# Altium schematic sheet fabscope_schematic.schdoc
size 594 x 419 mm; Symbol: Drawing-Symbol_A4; @Project Name: fab_scope_esp; @Page Count: 1; @Update Date: 2026-10-18; @Create Date: 2026-10-18; @Schematic Name: Schematic1; @Page No: 1; @Page Name: P1; Company: EasyEDA.com; Version: V1.0; Page Size: A4; Device: Drawing-Symbol_A4; @Create Time: 13:39:33; @Update Time: 13:39:33; Border: 1; Width: 2338; Height: 1652; Region Start: 1; X Region Count: 6; Y Region Count: 4; Blade Width: 10; Title Block Position: 3; @Board Name: Board1
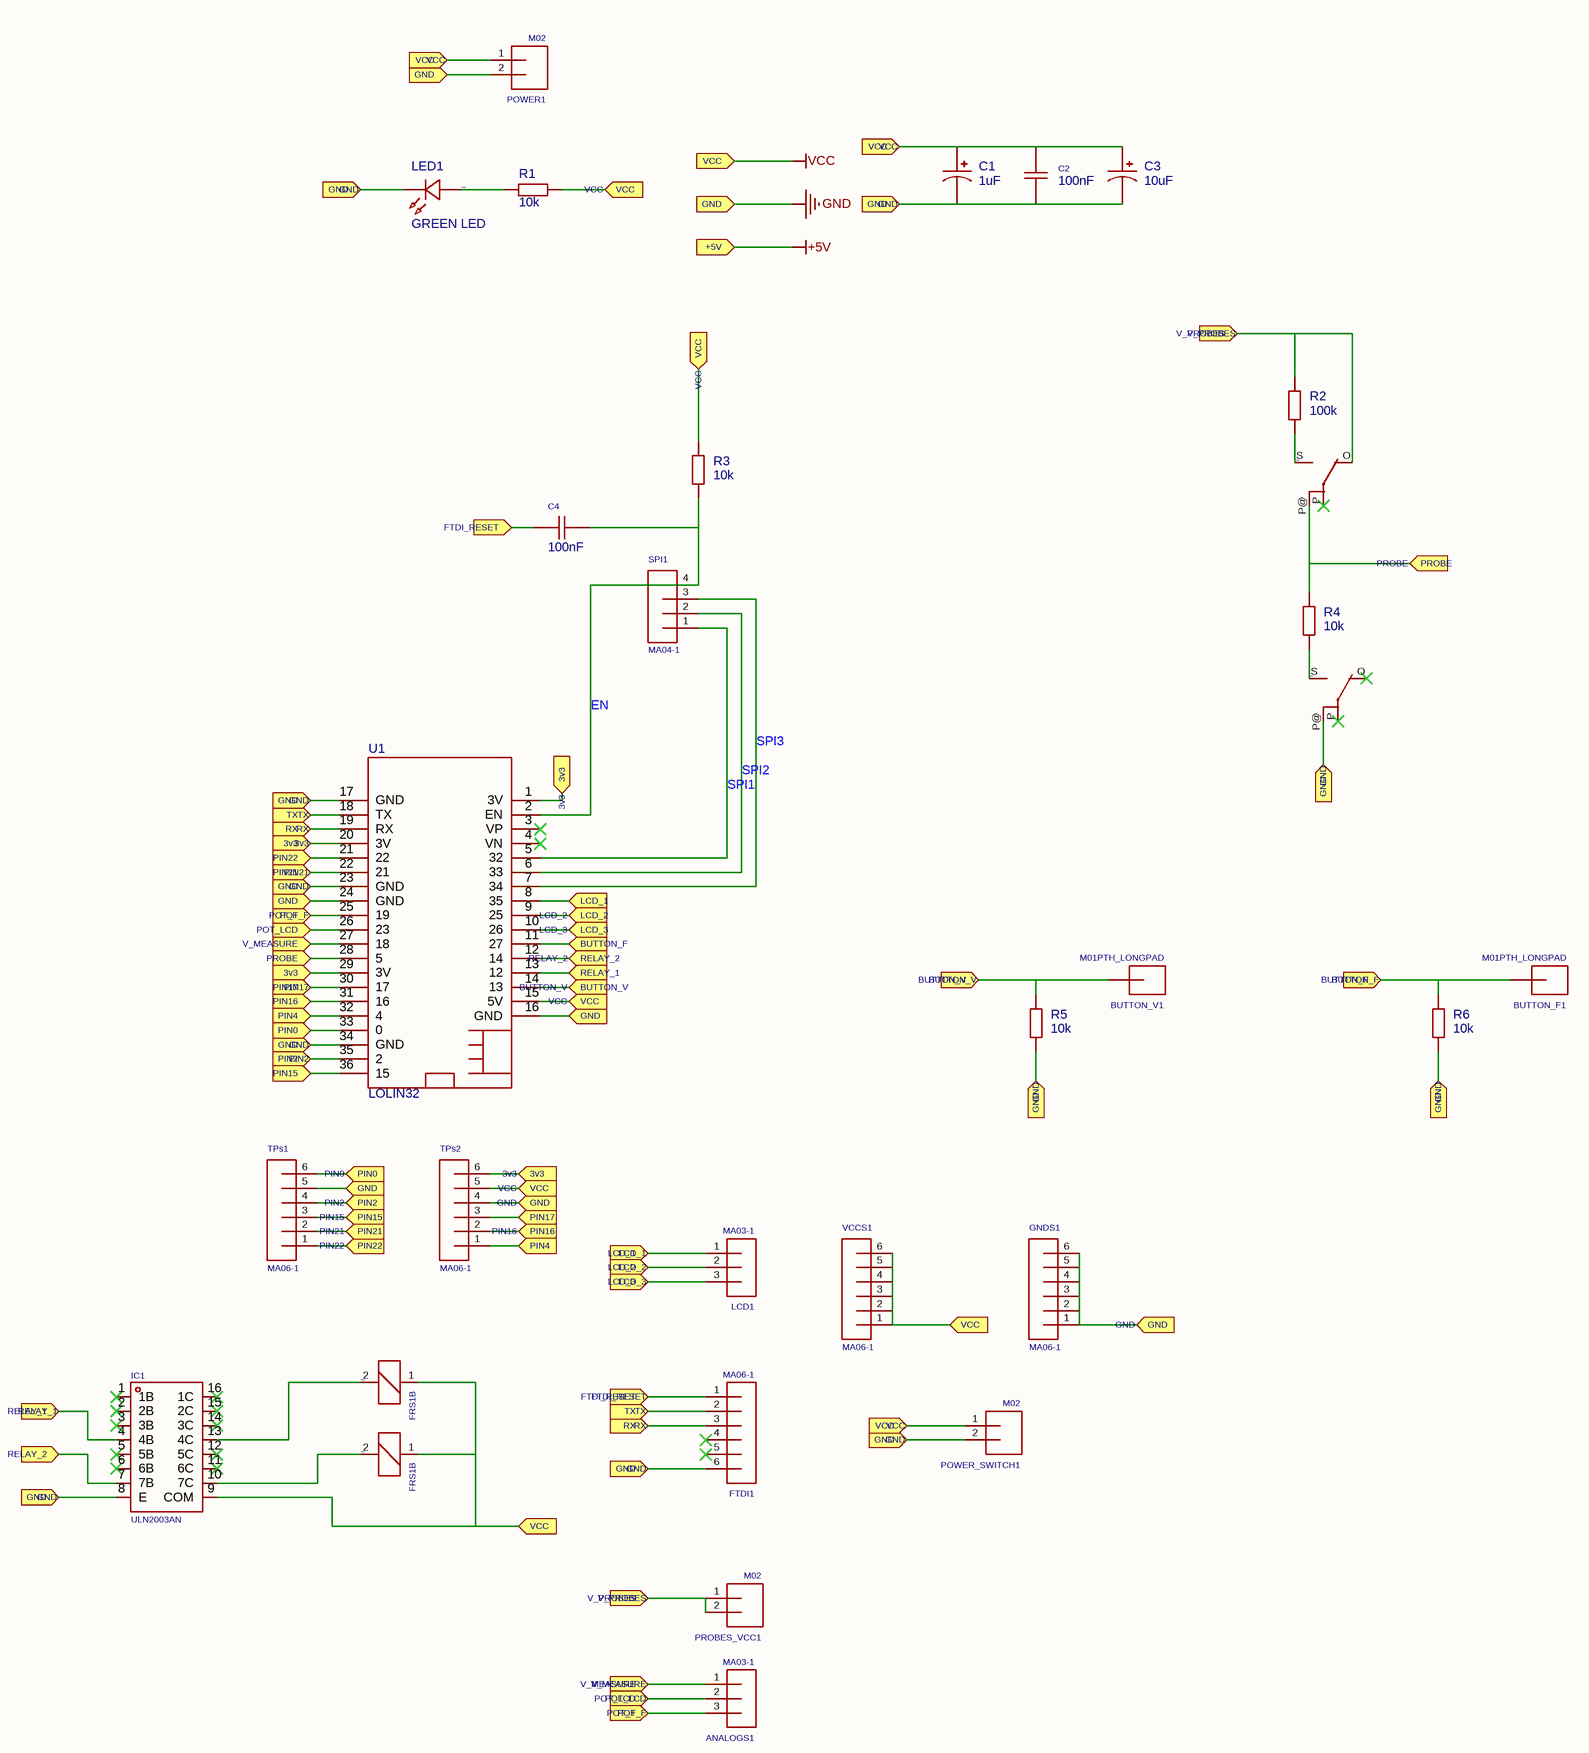
[diagram p0: fabscope_schematic.schdoc]

## Parts
ANALOGS1  MA03-1  [MA03-1]
BUTTON_F1  M01PTH_LONGPAD  [1X01_LONGPAD]
BUTTON_V1  M01PTH_LONGPAD  [1X01_LONGPAD]
C1  1uF  [CAP-TH_BD6.3-P5.00-D0.5-FD]
C2  100nF  [CAP-TH_L3.0-W2.0-P5.08-D0.7]
C3  10uF  [CAP-TH_BD5.0-P2.00-D0.8-FD]
C4  100nF  [CAP-TH_L3.0-W2.0-P5.08-D0.7]
FTDI1  MA06-1  [MA06-1]
GNDS1  MA06-1  [MA06-1]
IC1  ULN2003AN  [DIP-16_L19.7-W6.6-P2.54-LS7.6-BL]
K1  FRS1B  [FRS1B]  (parts A,B of 2)
K2  FRS1B  [FRS1B]  (parts A,B of 2)
LCD1  MA03-1  [MA03-1]
LED1  GREEN LED  [LED-TH_BD5.9-P2.54-FD-1]
POWER1  M02  [02P]
POWER_SWITCH1  M02  [02P]
PROBES_VCC1  M02  [02P]
R1  10k  [RES-TH_BD2.4-L6.3-P10.30-D0.6]
R2  100k  [RES-TH_BD2.4-L6.3-P10.30-D0.6]
R3  10k  [RES-TH_BD2.4-L6.3-P10.30-D0.6]
R4  10k  [RES-TH_BD2.4-L6.3-P10.30-D0.6]
R5  10k  [RES-TH_BD2.4-L6.3-P10.30-D0.6]
R6  10k  [RES-TH_BD2.4-L6.3-P10.30-D0.6]
SPI1  MA04-1  [MA04-1]
TPs1  MA06-1  [MA06-1]
TPs2  MA06-1  [MA06-1]
U1  LOLIN32  [LOLIN32]
VCCS1  MA06-1  [MA06-1]

## Ports
3v3 (in), +5V (in), BUTTON_F (in), BUTTON_V (in), FTDI_RESET (in), GND (in), LCD_1 (in), LCD_2 (in), LCD_3 (in), PIN0 (in), PIN2 (in), PIN4 (in), PIN15 (in), PIN16 (in), PIN17 (in), PIN21 (in), PIN22 (in), POT_F (in), POT_LCD (in), PROBE (in), RELAY_1 (in), RELAY_2 (in), RX (in), TX (in), V_MEASURE (in), V_PROBES (in), VCC (in)

## Nets
+5V: port +5V
GND: C1.2 C2.1 C3.2 FTDI1.6 GNDS1.1 GNDS1.2 GNDS1.3 GNDS1.4 GNDS1.5 GNDS1.6 IC1.8(E) K2.P@(P@1) LED1.2(K) POWER1.2 POWER_SWITCH1.2 R5.1 R6.1 TPs1.5 TPs2.4 U1.16(GND) U1.17(GND) U1.23(GND) U1.24(GND) U1.34(GND) ; port GND
VCC: C1.1 C2.2 C3.1 IC1.9(COM) K1.1 K2.1 POWER1.1 POWER_SWITCH1.1 R1.2 R3.2 TPs2.5 U1.15(5V) VCCS1.1 VCCS1.2 VCCS1.3 VCCS1.4 VCCS1.5 VCCS1.6 ; port VCC
3v3: TPs2.6 U1.1(3V) U1.20(3V) U1.29(3V) ; port 3v3
BUTTON_F: BUTTON_F1.1 R6.2 U1.11(27) ; port BUTTON_F
BUTTON_V: BUTTON_V1.1 R5.2 U1.14(13) ; port BUTTON_V
EN: C4.1 R3.1 SPI1.4 U1.2(EN)
FTDI_RESET: C4.2 FTDI1.1 ; port FTDI_RESET
LCD_1: LCD1.1 U1.8(35) ; port LCD_1
LCD_2: LCD1.2 U1.9(25) ; port LCD_2
LCD_3: LCD1.3 U1.10(26) ; port LCD_3
N$4: IC1.10(7C) K2.2
N$5: IC1.13(4C) K1.2
N$11: K2.S R4.1
N$14: K1.S R2.1
N$26: LED1.1(A) R1.1
PIN0: TPs1.6 U1.33(0) ; port PIN0
PIN2: TPs1.4 U1.35(2) ; port PIN2
PIN4: TPs2.1 U1.32(4) ; port PIN4
PIN15: TPs1.3 U1.36(15) ; port PIN15
PIN16: TPs2.2 U1.31(16) ; port PIN16
PIN17: TPs2.3 U1.30(17) ; port PIN17
PIN21: TPs1.2 U1.22(21) ; port PIN21
PIN22: TPs1.1 U1.21(22) ; port PIN22
POT_F: ANALOGS1.3 U1.25(19) ; port POT_F
POT_LCD: ANALOGS1.2 U1.26(23) ; port POT_LCD
PROBE: K1.P@(P@1) R4.2 U1.28(5) ; port PROBE
RELAY_1: IC1.4(4B) U1.13(12) ; port RELAY_1
RELAY_2: IC1.7(7B) U1.12(14) ; port RELAY_2
RX: FTDI1.3 U1.19(RX) ; port RX
SPI1: SPI1.1 U1.5(32)
SPI2: SPI1.2 U1.6(33)
SPI3: SPI1.3 U1.7(34)
TX: FTDI1.2 U1.18(TX) ; port TX
V_MEASURE: ANALOGS1.1 U1.27(18) ; port V_MEASURE
V_PROBES: K1.O PROBES_VCC1.1 PROBES_VCC1.2 R2.2 ; port V_PROBES

Not connected (* = marked no-connect by the designer): FTDI1 4* 5*; IC1 1(1B)* 2(2B)* 3(3B)* 5(5B)* 6(6B)* 11(6C)* 12(5C)* 14(3C)* 15(2C)* 16(1C)*; K1 P*; K2 O* P*; U1 3(VP)* 4(VN)*

## Notes on the sheet
- Create at
- 2026-10-18
- Schematic
- Board
- Schematic1
- Board1
- Update at
- Page
- P1
- Drawn
- Reviewed
- fab_scope_esp
- Version
- V1.0
- Size
- A4
- Page  1  Total  1
- EasyEDA.com

## Library data of the parts
ANALOGS1 LCD1 = con-lstb_MA03-1_: AddInBom: yes; Symbol: con-lstb_MA03-1_; Device: con-lstb_MA03-1_; Origin Footprint: MA03-1; FootprintName: MA03-1
BUTTON_F1 BUTTON_V1 = 01_SparkFun_M01_PTH_LONGPAD: AddInBom: yes; Symbol: 01_SparkFun_M01_PTH_LONGPAD; Device: 01_SparkFun_M01_PTH_LONGPAD; Origin Footprint: 1X01_LONGPAD; FootprintName: 1X01_LONGPAD
C1 = 511D105M100AA2D: Capacitance:1uF Tolerance:±20% Tolerance:±20% Voltage Rating:100V Pin Spacing:2.5mm Ripple Current:- Diameter:6.3mm Height - Seated (Max):11mm Lifetime:1000hrs@105℃ Operating Temperature:-40℃~+105℃ Operating Temperature:-40℃~+105℃ Polarity type:有极性; Manufacturer: VISHAY(威世); 3D Model: b6527ad10d8940138c70be24a7a25d5f0819f05c4eef4c71ace90d822a990e87; 3D Model Transform: 248.4247,248.02706,0,0,0,0,0,0,-137.795; Tolerance: ±20%; Voltage Rating: 100V; Pin Spacing: 2.5mm; Polarity type: 有极性; AddInBom: yes; Symbol: 511D105M100AA2D; Device: 511D105M100AA2D; LCSC Part Name: 1uF ±20% 100V; Supplier Part: C1602771; Manufacturer Part: 511D105M100AA2D; Supplier Footprint: 插件,D6.3xL11mm; JLCPCB Part Class: Extended Part; Datasheet: https://item.szlcsc.com/datasheet/511D105M100AA2D/1693613.html; Supplier: LCSC; Value: 1uF; Ripple Current: -; Diameter: 6.3mm; Height - Seated (Max): 11mm; Lifetime: 1000hrs@105℃; Operating Temperature: -40℃~+105℃; ConvertToPcb: yes; FootprintName: CAP-TH_BD6.3-P5.00-D0.5-FD; ModelName: CAP-TH_BD6.3-P5.00-D0.5-FD
C2 C4 = FG28X7R1H104KNT00: Capacitance:100nF Tolerance:±10% Tolerance:±10% Voltage Rating:50V Temperature Coefficient:X7R; Manufacturer: TDK; 3D Model: 1259a8756a014369bd572252842bd7040819f05c4eef4c71ace90d822a990e87; 3D Model Transform: 215.7476,78.74,0,0,0,0,0,0,-137.795; Tolerance: ±10%; Voltage Rating: 50V; Temperature Coefficient: X7R; AddInBom: yes; ModelName: CAP-TH-L3.2-W2.0-H2.2-P5.08; Symbol: FG28X7R1H104KNT00; Device: FG28X7R1H104KNT00; LCSC Part Name: 100nF ±10% 50V; Supplier Footprint: 插件,P=5mm; Datasheet: https://item.szlcsc.com/datasheet/FG28X7R1H104KNT00/450783.html; Supplier: LCSC; Supplier Part: C448595; Manufacturer Part: FG28X7R1H104KNT00; Value: 100nF; JLCPCB Part Class: Extended Part; ConvertToPcb: yes; FootprintName: CAP-TH_L3.0-W2.0-P5.08-D0.7
C3 = 01EC1809SHC10UF50V: Capacitance:10uF Tolerance:±20% Tolerance:±20% Voltage Rating:50V Ripple Current:50mA@120Hz Equivalent Series Resistance(ESR):- Pin Spacing:2mm Diameter:5mm Height - Seated (Max):11mm Lifetime:2000hrs@105℃ Operating Temperature:-40℃~+105℃ Operating Temper; Manufacturer: KNSCHA(科尼盛); 3D Model: a6753ac7f17a4fce96dd233a0f76b1540819f05c4eef4c71ace90d822a990e87; 3D Model Transform: 197.091,196.7911,0,0,0,0,0,0,-137.795; Tolerance: ±20%; Voltage Rating: 50V; Pin Spacing: 2mm; AddInBom: yes; ModelName: CAP-TH_D5.0×H7.0×P2.0; Symbol: 01EC1809SHC10UF50V; Device: 01EC1809SHC10UF50V; LCSC Part Name: 10uF ±20% 50V; Supplier Part: C503219; Manufacturer Part: 01EC1809SHC10UF50V; Supplier Footprint: 插件,D5xL11mm; JLCPCB Part Class: Extended Part; Datasheet: https://item.szlcsc.com/datasheet/01EC1809SHC10UF50V/515632.html; Supplier: LCSC; Value: 10uF; Ripple Current: 50mA@120Hz; Equivalent Series Resistance(ESR): -; Diameter: 5mm; Height - Seated (Max): 11mm; Lifetime: 2000hrs@105℃; Operating Temperature: -40℃~+105℃; ConvertToPcb: yes; FootprintName: CAP-TH_BD5.0-P2.00-D0.8-FD
FTDI1 GNDS1 TPs1 TPs2 VCCS1 = con-lstb_MA06-1_: AddInBom: yes; Symbol: con-lstb_MA06-1_; Device: con-lstb_MA06-1_; Origin Footprint: MA06-1; FootprintName: MA06-1
IC1 = ULN2003AN_C7432319: number of channels:Seven channels Collector - Emitter Voltage VCEO:50V Current - Collector(Ic):500mA Voltage - Input(Max):30V Operating Temperature:-40℃~+85℃ Operating Temperature:-40℃~+85℃ Output Leakage Current(Icex):20uA Input Current(on):0.93mA Input; Manufacturer: HGSEMI(华冠); Add into BOM: yes; 3D Model: 0a9e441a197a485eb609f0a893c5537e; 3D Model Transform: 775.589,309.0545,0,0,0,0,0,0,-129.921; Collector - Emitter Voltage VCEO: 50V; Current - Collector(Ic): 500mA; Voltage - Input(Max): 30V; Output Leakage Current(Icex): 20uA; Input Current(on): 0.93mA; Input Current(off): 100uA; Symbol: ULN2003AN_C7432319; Device: ULN2003AN_C7432319; Convert to PCB: yes; LCSC Part Name: 七路高增益达林顿阵列功率驱动集成电路; Supplier Part: C7432319; Manufacturer Part: ULN2003AN; Supplier Footprint: DIP-16; JLCPCB Part Class: Extended Part; Datasheet: https://item.szlcsc.com/datasheet/ULN2003AN/8436768.html; Supplier: LCSC; number of channels: Seven channels; Operating Temperature: -40℃~+85℃; FootprintName: DIP-16_L19.7-W6.6-P2.54-LS7.6-BL; ModelName: DIP-16_L19.7-W6.6-P2.54-LS7.6-BL
K1 = relay_FRS1B_: Multi-Part Group: K1; Relevance: []; AddInBom: yes; Symbol: relay_FRS1B_; Device: relay_FRS1B_; Origin Footprint: FRS1B; FootprintName: FRS1B
K2 = relay_FRS1B_: Multi-Part Group: K2; Relevance: []; AddInBom: yes; Symbol: relay_FRS1B_; Device: relay_FRS1B_; Origin Footprint: FRS1B; FootprintName: FRS1B
LED1 = LED蓝色: Add into BOM: yes; 3D Model: d4570ab2a1de4d5088d109a1d068ae420819f05c4eef4c71ace90d822a990e87; 3D Model Transform: 212.9917,232.219,0,0,0,0,-9.842,0,-196.85; Symbol: LED蓝色; Device: LED蓝色; LCSC Part Name: LED蓝色; Supplier Part: C9900049000; Manufacturer Part: GREEN LED; Supplier Footprint: LED-TH; JLCPCB Part Class: Extended Part; Supplier: LCSC; ConvertToPcb: yes; FootprintName: LED-TH_BD5.9-P2.54-FD-1; ModelName: LED-TH_BD5.9-P2.54-FD-1
POWER1 POWER_SWITCH1 PROBES_VCC1 = con-amp-quick_M02_: AddInBom: yes; Symbol: con-amp-quick_M02_; Device: con-amp-quick_M02_; Origin Footprint: 02P; FootprintName: 02P
R1-R6 = MFR-25FTE52-4K7: Type:Metal Film Resistors Resistance: Tolerance:±1% Tolerance:±1% Power(Watts):250mW Temperature Coefficient:±50ppm/℃ Temperature Coefficient:±50ppm/℃ Operating Temperature:-55℃~+155℃ Operating Temperature:-55℃~+155℃; Manufacturer: YAGEO(国巨); 3D Model: 1723974b41284f5c8da509f1f508e9550819f05c4eef4c71ace90d822a990e87; 3D Model Transform: 427.165,94.32816,0,0,0,0,0,0,-196.85; Tolerance: ±1%; Power(Watts): 250mW; AddInBom: yes; Symbol: MFR-25FTE52-4K7; Device: MFR-25FTE52-4K7; LCSC Part Name: 金属膜电阻 4.7kΩ ±1% 250mW 铜脚，圆柱状直插; Manufacturer Part: MFR-25FTE52-4K7; Supplier Footprint: 插件,D2.4xL6.3mm; JLCPCB Part Class: Extended Part; Datasheet: https://atta.szlcsc.com/upload/public/pdf/source/20191118/C457825_18355E864DE4965678DC27B0EBC3E21E.pdf; Supplier: LCSC; Type: Metal Film Resistors; Temperature Coefficient: ±50ppm/℃; Operating Temperature: -55℃~+155℃; ConvertToPcb: yes; FootprintName: RES-TH_BD2.4-L6.3-P10.30-D0.6; ModelName: RES-TH_BD2.4-L6.3-P10.30-D0.6
  R1 R3-R6: Value: 10k
  R2: Value: 100k
SPI1 = con-lstb_MA04-1_: AddInBom: yes; Symbol: con-lstb_MA04-1_; Device: con-lstb_MA04-1_; Origin Footprint: MA04-1; FootprintName: MA04-1
U1 = LOLIN32: Manufacturer: WeMos; AddInBom: yes; Symbol: LOLIN32; Device: LOLIN32; ConvertToPcb: yes; FootprintName: LOLIN32